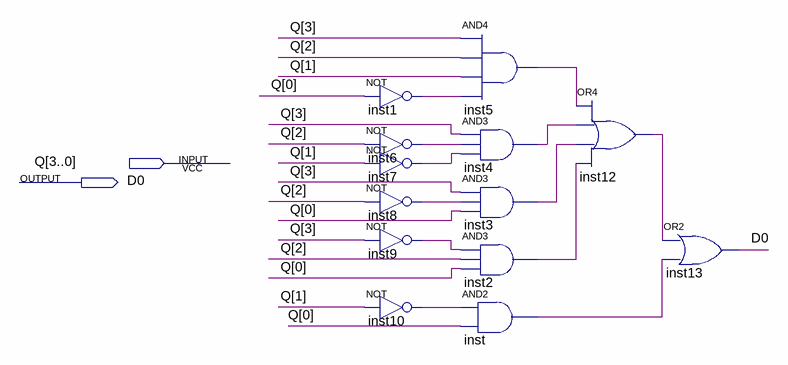
[diagram p0: schematic sheet]
// Quartus schematic d0_logic.bdf as structural Verilog: 13 symbols, 2 pins
module d0_logic (
  input  [3:0] Q,
  output D0
);

  wire inst1_out, inst2_out, inst3_out, inst4_out, inst5_out, inst6_out, inst7_out, inst8_out, inst9_out,
       inst10_out, inst12_out, inst_out;

  not inst1 (inst1_out, Q[0]);
  not inst6 (inst6_out, Q[2]);
  not inst7 (inst7_out, Q[1]);
  not inst8 (inst8_out, Q[2]);
  not inst9 (inst9_out, Q[3]);
  not inst10 (inst10_out, Q[1]);
  and inst5 (inst5_out, Q[3], Q[2], Q[1], inst1_out);
  and inst4 (inst4_out, Q[3], inst6_out, inst7_out);
  and inst3 (inst3_out, Q[3], inst8_out, Q[0]);
  and inst2 (inst2_out, inst9_out, Q[2], Q[0]);
  and inst (inst_out, inst10_out, Q[0]);
  or inst12 (inst12_out, inst5_out, inst4_out, inst3_out, inst2_out);
  or inst13 (D0, inst12_out, inst_out);
endmodule
